# Altium schematic sheet 07_70_DEBUG_BOOT.SchDoc
size 289 x 396 mm
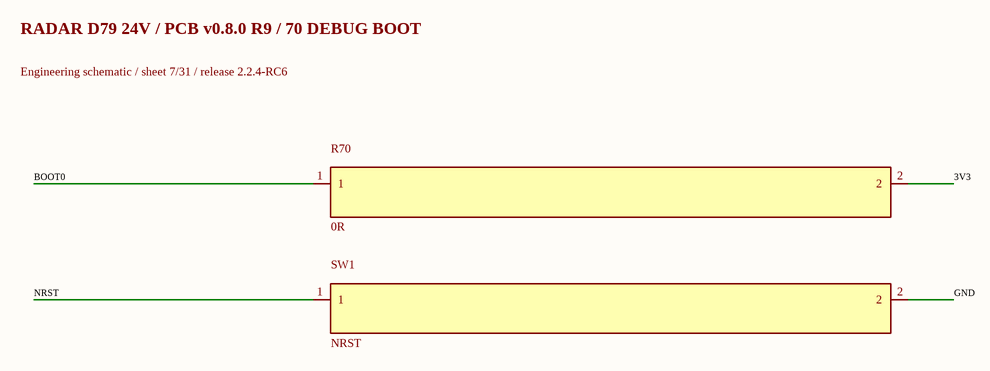
[diagram p0: 07_70_DEBUG_BOOT.SchDoc]

## Parts
R70  0R  [R_0603_1608Metric]
SW1  NRST  [ESwitch_TL3301_GullWing_6x6]

## Nets
3V3: R70.2
BOOT0: R70.1
GND: SW1.2
NRST: SW1.1

## Notes on the sheet
- RADAR D79 24V / PCB v0.8.0 R9 / 70 DEBUG BOOT
- Engineering schematic / sheet 7/31 / release 2.2.4-RC6